# EasyEDA Pro project emg_frontend_reference.epro

# Schematic Schematic1
Assembly Variant: Basic; Board Name: Board1; Create Date: 2026-09-09; Page Name: P1; Project Name: esp32_demo; Schematic Name: Schematic1; Update Date: 2026-09-09; Company: 嘉立创EDA; Page Size: A4; Version: V1.0
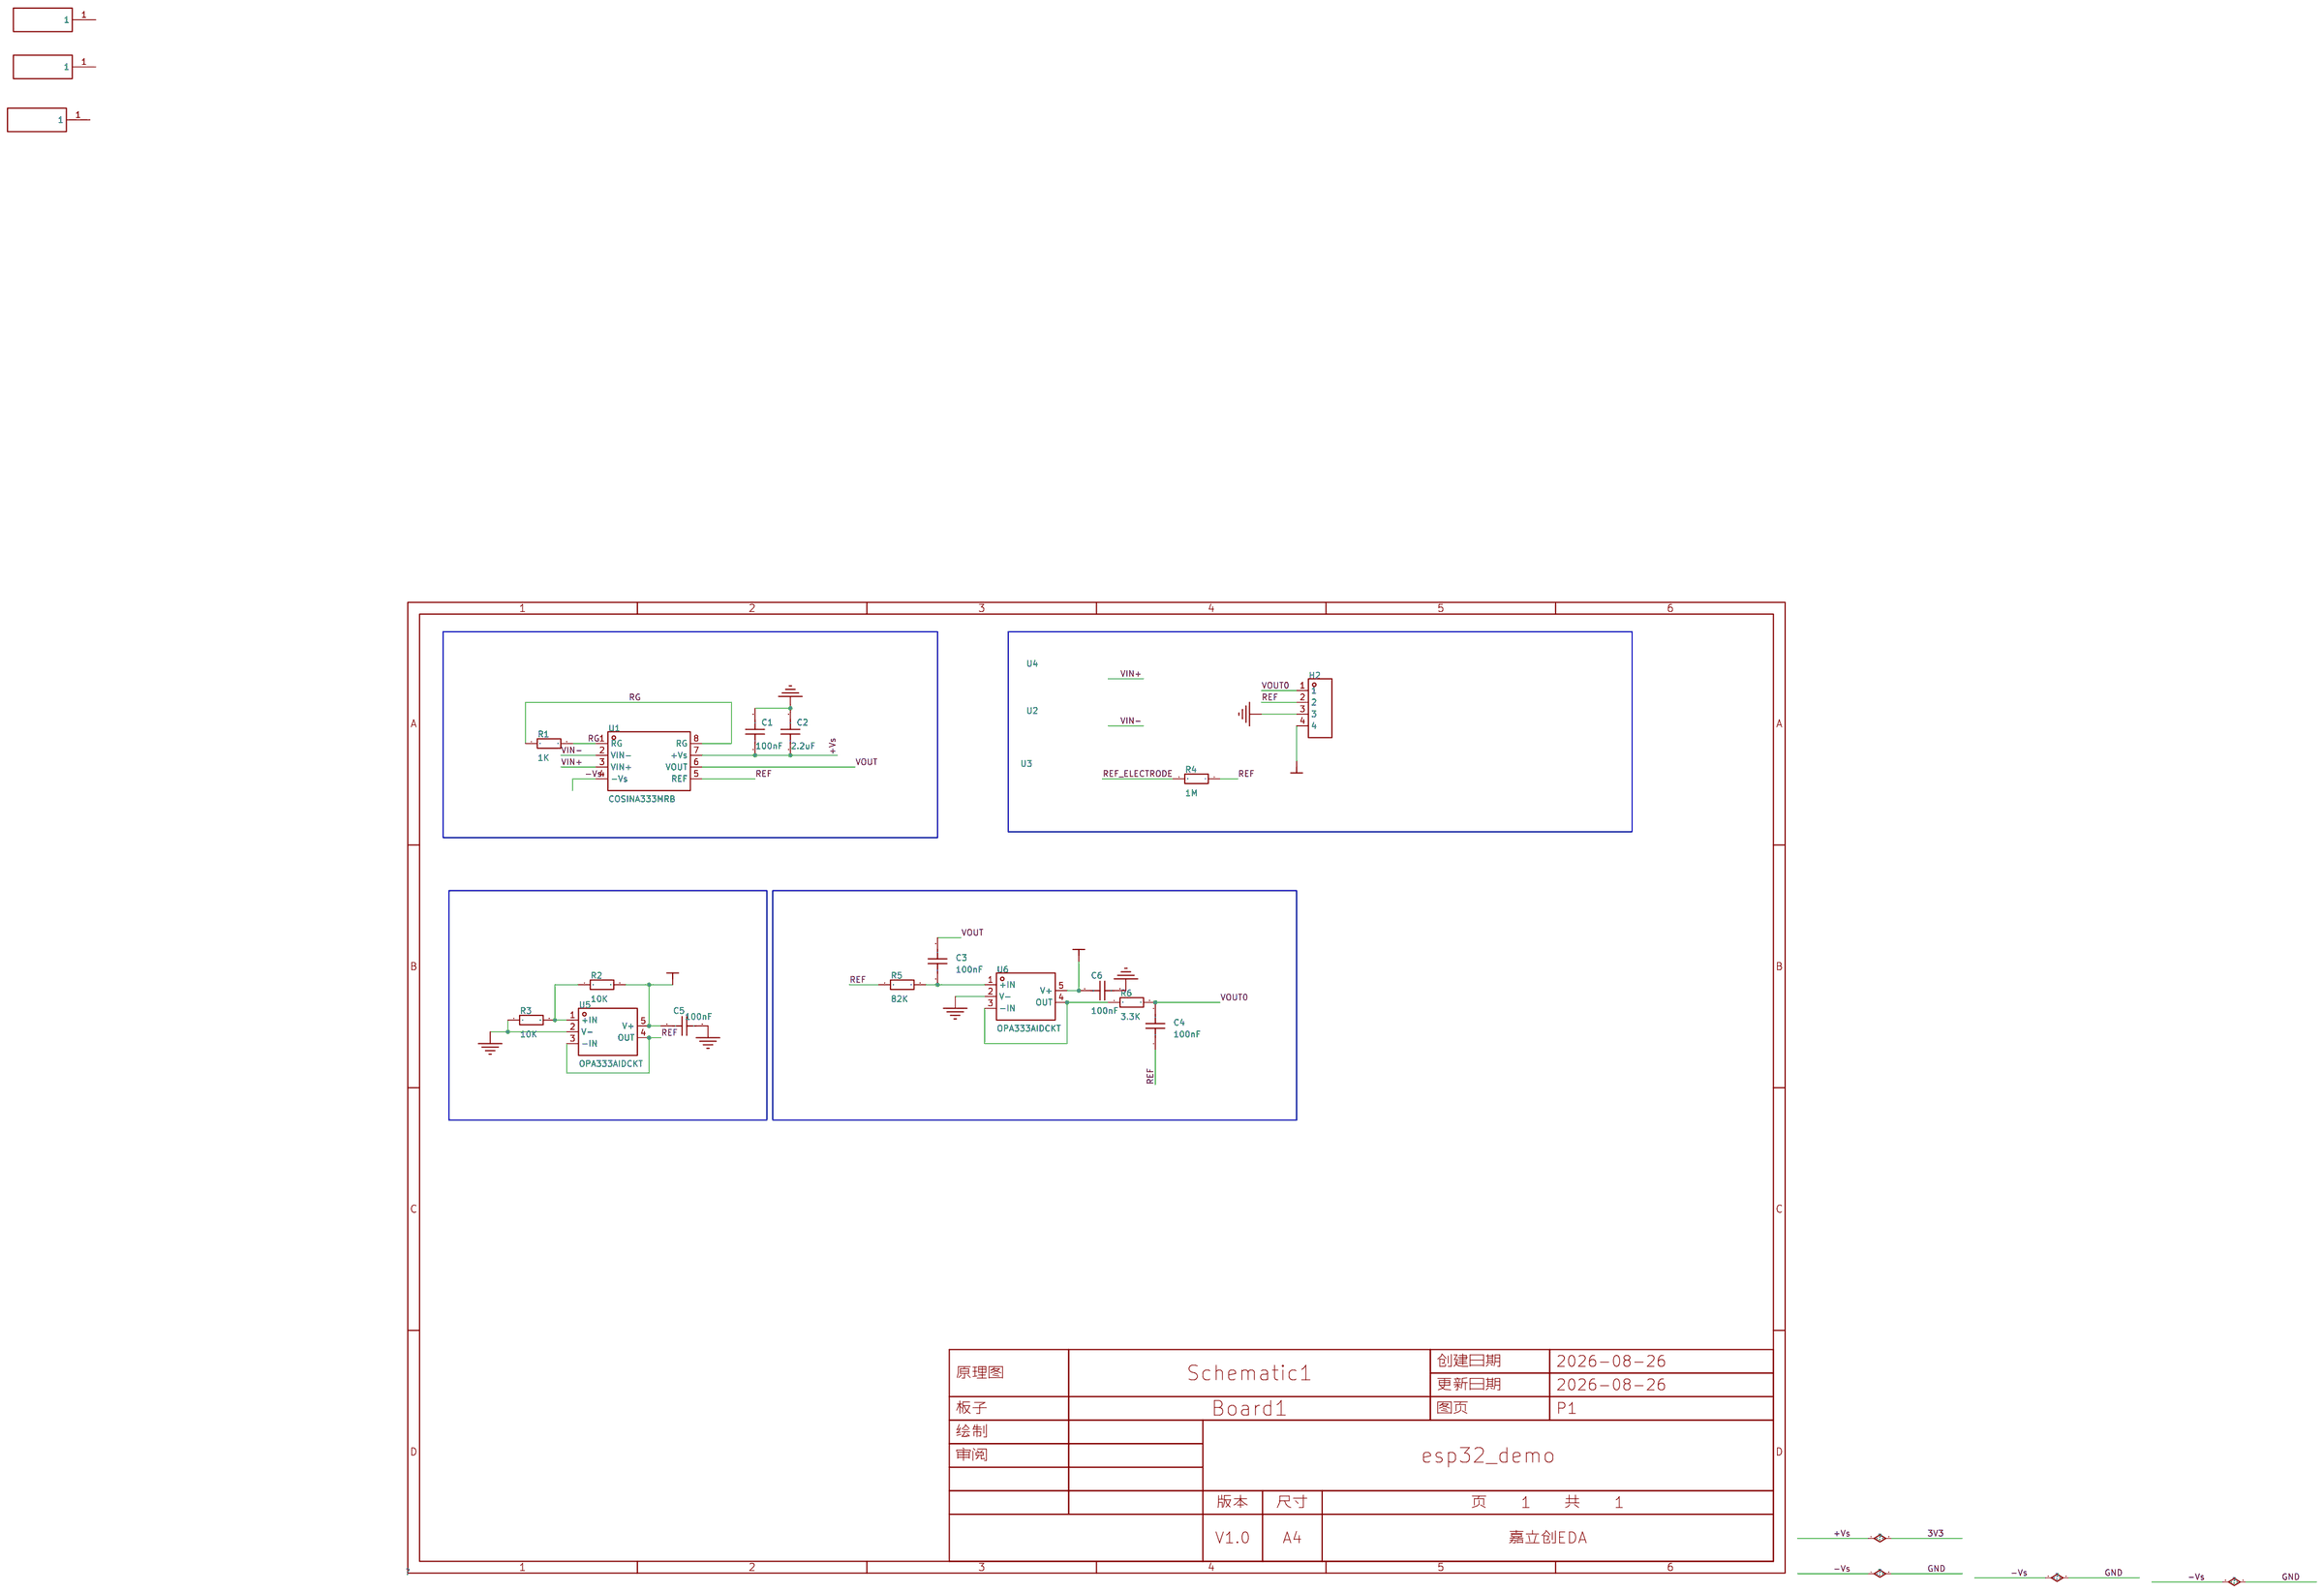
[diagram p0: schematic sheet]

## Parts
C1  100nF  [C0603]
C2  2.2uF  [C0603]
C3  100nF  [C0603]
C4  100nF  [C0603]
C5  100nF  [C0603]
C6  100nF  [C0603]
H2  -  [HDR-TH_4P-P2.54-V-F]
R1  1K  [R0603]
R2  10K  [R0603]
R3  10K  [R0603]
R4  1M  [R0603]
R5  82K  [R0603]
R6  3.3K  [R0603]
U1  COSINA333MRB  [MSOP-8_L3.0-W3.0-P0.65-LS4.9-BL]
U2  -  [EMG_D]
U3  -  [EMG_D]
U4  -  [EMG_D]
U5  OPA333AIDCKT  [SC-70-5_L2.0-W1.3-P0.65-LS2.1-BL]
U6  OPA333AIDCKT  [SC-70-5_L2.0-W1.3-P0.65-LS2.1-BL]

## Library data of the parts
C1-C6 = CAP_0603: Supplier Footprint: 0603
H2 = HDR-F_2.54_1x4P: Supplier Part: C2718488; Supplier Footprint: 插件
R1-R6 = Res_0603: Supplier Footprint: 0603
U1 = COSINA333MRB: 放大器数:单路;共模抑制比(CMRR):120dB;输入偏置电流(Ib):200pA;输入失调电压(Vos):25uV;压摆率(SR):0.25V/us;轨到轨:轨到轨输入,轨到轨输出;; LCSC Part Name: 1.8V - 5.5V, 70uA, RRIO零漂移仪表放大器; Supplier Part: C17702539; Manufacturer: COSINE(科山芯创); Supplier Footprint: MSOP-8; JLCPCB Part Class: Extended Part; Datasheet: https://item.szlcsc.com/datasheet/COSINA333MRB/18841710.html; Supplier: LCSC; Number of Channels: 单路; Common Mode Rejection Ratio(CMRR): 120dB; Ib - Input Bias Current: 200pA; Vos - Input Offset Voltage: 25uV; Slew Rate: 0.25V/us; Output Current: 50mA; Rail to Rail: 轨到轨输入,轨到轨输出; Quiescent Current(Iq): 70uA; Input Offset Voltage Drift(Vos TC): 50nV/℃; Operating Temperature: -40℃~+125℃; Input Voltage Noise Density: 50nV/√Hz@1kHz; Input Offset Current(Ios): 3pA; Single Supply: 1.8V~5.5V; Dual Supply: -2.75V~-900mV；900mV~2.75V; Power Supply Rejection Ratio (PSRR): 130dB; Features: 外部电阻增益；零漂移/自动稳零
U2-U4 = EMG_D1
U5 U6 = OPA333AIDCKT: 放大器数:单路;增益带宽积(GBP):350kHz;输入偏置电流(Ib):70pA;输入失调电压(Vos):10uV;压摆率(SR):0.16V/us;轨到轨:轨到轨输入,轨到轨输出;; LCSC Part Name: OPAx333 1.8V微功耗CMOS运算放大器零漂移系列; Supplier Part: C2057324; Manufacturer: TI(德州仪器); Supplier Footprint: SC-70-5; JLCPCB Part Class: Extended Part; Datasheet: https://www.ti.com/cn/lit/gpn/opa333; Supplier: LCSC; Number of Channels: 单路; Gain Bandwidth Product: 350kHz; Ib - Input Bias Current: 70pA; Vos - Input Offset Voltage: 10uV; Common Mode Rejection Ratio(CMRR): 130dB; Slew Rate: 0.16V/us; Output Current: 5mA; Rail to Rail: 轨到轨输入,轨到轨输出; Input Offset Voltage Drift(Vos TC): 50nV/℃; Quiescent Current(Iq): 17uA; Operating Temperature: -40℃~+125℃; Single Supply: 1.8V~5.5V; Maximum Power Supply Range (Vdd-Vss): 5.5V; Input Offset Current(Ios): 400pA

## Nets
3V3: C1.1 C2.1 C5.1 C6.1 H2.4 R2.2 U1.7(+Vs) U5.5(V+) U6.5(V+)
GND: C1.2 C2.2 C5.2 C6.2 H2.3 R3.1 U1.4(-Vs) U5.2(V-) U6.2(V-)
VIN+: U1.3(VIN+)
VIN-: U1.2(VIN-)
REF: C4.1 H2.2 R4.1 R5.1 U1.5(REF) U5.3(-IN) U5.4(OUT)
REF_ELECTRODE: R4.2
RG: R1.1 R1.2 U1.1(RG) U1.8(RG)
VOUT: C3.2 U1.6(VOUT)
VOUT0: C4.2 H2.1 R6.2
$1N490: R2.1 R3.2 U5.1(+IN)
$1N509: C3.1 R5.2 U6.1(+IN)
$1N512: R6.1 U6.3(-IN) U6.4(OUT)

Not connected (* = marked no-connect by the designer): U2 1; U3 1; U4 1

# Board PCB1_1
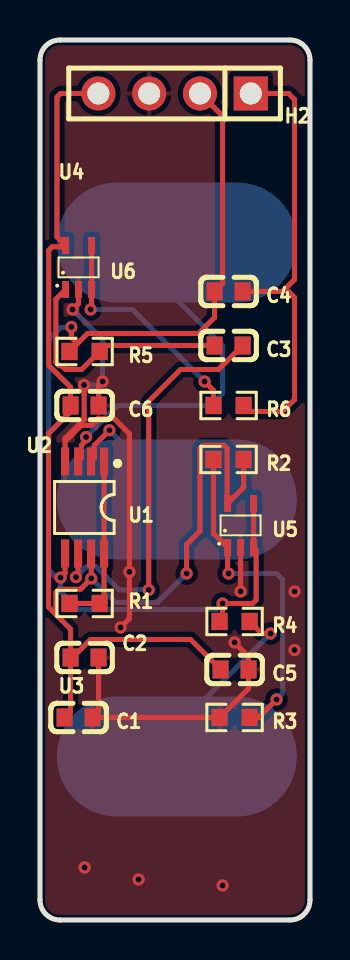
[diagram p1: board, top side]
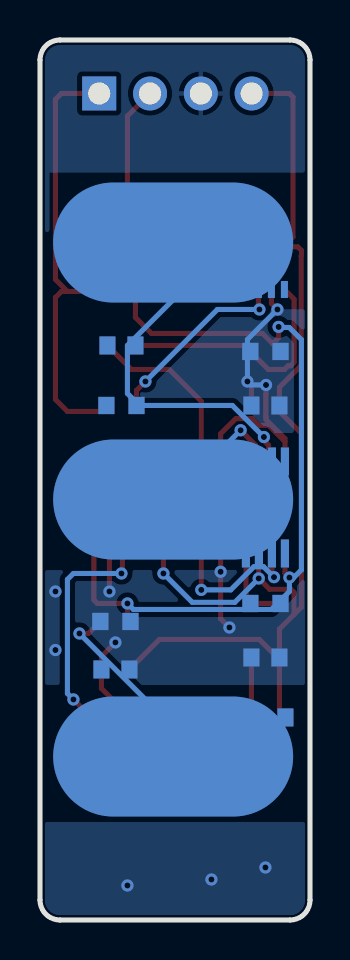
[diagram p2: board, bottom side, seen from below]

Outline 13.5 x 44 mm; copper layers: Top Layer, Bottom Layer. Coordinates in mm from the lower left corner of the outline.
Outline path: 0,43 arc(0.29,43.71) 1,44 12.5,44 arc(13.21,43.71) 13.5,43 13.5,1 arc(13.21,0.29) 12.5,0 1,0 arc(0.29,0.29) 0,1 0,43
Stack: Top Layer 0.035mm / Dielectric1 1.51mm FR4 er 4.5 / Bottom Layer 0.035mm

## Design rules (mm)
spacing copperThickness1oz (default): track to track 0.102, other pairs 0.152 to 0.3
spacing copperThickness2oz: track to track 0.203, other pairs 0.152 to 0.3
spacing Plane_innerPlane: track to track 0.102, other pairs 0.152 to 0.3
spacing Copper_copperRegion: track to track 0.102, other pairs 0.152 to 0.3
track width copperThickness1oz (default): min 0.127, default 0.254, max 2.54
track width copperThickness2oz: min 0.203, default 0.254, max 2.54
differential pair differentialPair (default): width min 0.127, default 0.254, max 2.54; gap min 0.152, default 0.152
net GND uses copperRegion_copperThickness1oz
net REF_ELECTRODE uses copperRegion_copperThickness1oz
net REF uses copperRegion_copperThickness1oz
net $1N512 uses copperRegion_copperThickness1oz
pour e256 uses Copper_copperRegion, copperRegion_Copper_copperRegion
net VOUT0 uses copperRegion_copperThickness1oz
net VOUT uses copperRegion_copperThickness1oz
pour e275 uses Copper_copperRegion, copperRegion_Copper_copperRegion
pour e308 uses Copper_copperRegion, copperRegion_Copper_copperRegion
pour e320 uses Copper_copperRegion, copperRegion_Copper_copperRegion
pour e334 uses Copper_copperRegion, copperRegion_Copper_copperRegion

## Placement (name value [footprint] x y rotation side)
C1  100nF  [C0603]  1.93 10.13 0 top
C2  2.2uF  [C0603]  2.23 13.13 0 top
C3  100nF  [C0603]  9.43 28.73 0 top
C4  100nF  [C0603]  9.43 31.43 0 top
C5  100nF  [C0603]  9.73 12.53 0 top
C6  100nF  [C0603]  2.23 25.73 0 top
H2  -  [HDR-TH_4P-P2.54-V-F]  6.73 41.33 180 top
R1  1K  [R0603]  2.23 15.83 0 top
R2  10K  [R0603]  9.43 23.03 0 top
R3  10K  [R0603]  9.73 10.13 0 top
R4  1M  [R0603]  9.73 14.93 0 top
R5  82K  [R0603]  2.23 28.43 0 top
R6  3.3K  [R0603]  9.43 25.73 0 top
U1  COSINA333MRB  [MSOP-8_L3.0-W3.0-P0.65-LS4.9-BL]  2.23 20.63 180 top
U2  -  [EMG_D]  6.59 21.15 0 top
U3  -  [EMG_D]  6.59 8.3 0 top
U4  -  [EMG_D]  6.59 34 0 top
U5  OPA333AIDCKT  [SC-70-5_L2.0-W1.3-P0.65-LS2.1-BL]  10.03 19.73 0 top
U6  OPA333AIDCKT  [SC-70-5_L2.0-W1.3-P0.65-LS2.1-BL]  1.93 32.63 0 top

## Footprints (pads in the part's own frame, mm; a bottom-side part is the same pattern mirrored in y, then rotated)
C0603
  rect 0.8x0.9 hole 0.001: 1(-0.7,0) 2(0.7,0)
EMG_D
  oval 12x6 smd far side: 1(0.254,-0.127)
HDR-TH_4P-P2.54-V-F
  rect 1.7x1.7 hole 1.1: 1(-3.81,0)
  round 1.7 hole 1.1: 2(-1.27,0) 3(1.27,0) 4(3.81,0)
MSOP-8_L3.0-W3.0-P0.65-LS4.9-BL
  rect 0.406x1.397 hole 0.001: 1(-0.975,-2.3) 2(-0.325,-2.3) 3(0.325,-2.3) 4(0.975,-2.3) 5(0.975,2.3) 6(0.325,2.3) 7(-0.325,2.3) 8(-0.975,2.3)
R0603
  rect 0.806x0.864 hole 0.001: 1(-0.753,0) 2(0.753,0)
SC-70-5_L2.0-W1.3-P0.65-LS2.1-BL
  rect 0.35x0.85 hole 0.001: 1(-0.65,-1.1) 2(0,-1.1) 3(0.65,-1.1) 4(0.65,1.1) 5(-0.65,1.1)

## Nets
3V3: C1.1 C2.1 C5.1 C6.1 H2.4 R2.2 U1.7 U5.5 U6.5
GND: C1.2 C2.2 C5.2 C6.2 H2.3 R3.1 U1.4 U5.2 U6.2
VIN+: U1.3 U4.1
VIN-: U1.2 U2.1
REF: C4.1 H2.2 R4.1 R5.1 U1.5 U5.3 U5.4
REF_ELECTRODE: R4.2 U3.1
RG: R1.1 R1.2 U1.1 U1.8
VOUT: C3.2 U1.6
VOUT0: C4.2 H2.1 R6.2
$1N490: R2.1 R3.2 U5.1
$1N509: C3.1 R5.2 U6.1
$1N512: R6.1 U6.3 U6.4

## Via types
v1: diameter 0.61, hole 0.305, Top Layer to Bottom Layer, 26 vias

## Routing (per net, layer and track width the routed paths; a pad name or vN(x,y) marks a point on that pad's centre or on a via; arc(x,y) is an arc through that point)
3V3: length 67.6
  Top Layer w0.254: H2.4 1.03,41.33 0.85,41.15 0.85,34.16 U6.5 1.21,33.66 0.61,33.66 0.43,33.48 0.43,33.23 0.44,33.22 0.44,27.73 1.53,26.64 1.53,25.43 0.43,24.33 0.43,15.64 0.79,15.28 ; 0.79,15.28 1.53,14.54 C2.1 ; 0.79,15.28 0.79,16.37 0.96,16.54 2.02,16.54 v1(2.56,17.08) 2.56,18.32 U1.7 ; C2.1 1.53,10.43 C1.1 ; C2.1 1.63,13.13 2.53,14.03 7.53,14.03 C5.1 ; R2.2 10.18,21.63 U5.5 9.36,20.85 9.36,23.57 9.19,23.74 8.16,23.74 7.99,23.57 7.99,19.44 7.33,18.78 v1(7.33,17.33)
  Bottom Layer w0.254: v1(2.56,17.08) 3.76,15.88 5.88,15.88 v1(7.33,17.33)
GND: length 42.3
  Top Layer w0.254: 2.93,25.43 2.93,26.73 v1(3.13,26.93) ; v1(2.2,26.75) 2.2,26.3 2.21,26.29 2.21,25.16 2.2,25.15 2.2,25.02 1.25,24.08 1.25,23.92 ; 1.25,23.92 2.06,24.73 2.55,24.73 2.88,25.07 3.71,25.07 4.47,24.31 v1(4.47,17.41) 4.47,15.07 v1(4.03,14.63) ; 1.25,23.92 U1.4 ; U6.2 1.93,30.83 v1(1.63,30.53) ; v1(9.73,13.88) 10.43,13.18 C5.2 10.43,11.58 R3.1 C1.2 2.93,10.43 C2.2 ; U5.2 v1(10.03,16.43)
  Bottom Layer w0.254: v1(2.2,26.75) 2.95,26.75 v1(3.13,26.93) 3.13,29.03 v1(1.63,30.53)
  vias: v1(2.23,2.63) v1(4.93,2.03) v1(9.13,1.73) v1(12.73,16.43) v1(12.73,13.5)
VIN+: length 17.6
  Top Layer w0.254: v1(2.31,24.15) 2.31,23.97 2.07,23.74 2.07,23.09 U1.3
  Bottom Layer w0.254: v1(2.31,24.15) 3.88,25.73 8.53,25.73 9.13,26.33 9.13,28.73 6.84,31.01 U4.1
VIN-: length 6.8
  Top Layer w0.254: v1(3.47,24.49) 2.72,23.74 2.72,23.09 U1.2
  Bottom Layer w0.254: v1(3.47,24.49) 6.84,21.11 U2.1
REF: length 52.6
  Top Layer w0.254: R4.1 9.13,15.08 v1(9.13,15.83) 10.63,15.83 10.81,16.01 10.81,18.5 U5.3 U5.4 ; U1.5 1.25,17.35 v1(1.03,17.12) ; v1(1.57,29.65) 1.57,29.12 1.87,28.82 ; H2.2 9.13,40.2 9.13,31.83 C4.1 8.73,30.13 7.93,29.33 2.38,29.33 1.87,28.82 ; 1.87,28.82 R5.1
  Bottom Layer w0.254: v1(9.13,15.83) 8.83,15.53 1.93,15.53 1.03,16.43 v1(1.03,17.12) 0.81,17.12 0.43,17.51 0.43,29.02 1.04,29.63 1.54,29.63 v1(1.57,29.65)
REF_ELECTRODE: length 9.4
  Top Layer w0.254: v1(11.53,14.33) 11.08,14.33 R4.2
  Bottom Layer w0.254: v1(11.53,14.33) 6.84,9.64 U3.1
RG: length 8.7
  Top Layer w0.254: R1.1 R1.2 3.2,16.05 3.2,22.93
VOUT: length 20.8
  Top Layer w0.254: U1.6 1.9,17.25 v1(1.8,17.14) ; v1(5.44,16.51) 5.44,25.93 7.03,27.53 8.93,27.53 C3.2
  Bottom Layer w0.254: v1(1.8,17.14) 2.32,17.66 2.81,17.66 3.96,16.51 v1(5.44,16.51)
VOUT0: length 22.9
  Top Layer w0.254: 12.13,31.43 12.73,32.03 12.73,41.03 12.43,41.33 H2.1 ; C4.2 12.43,31.43 12.73,31.13 12.73,26.03 12.13,25.43 10.48,25.43 R6.2
$1N490: length 16.7
  Top Layer w0.254: R3.2 10.93,10.13 v1(11.83,11.03) ; R2.1 8.68,19.33 U5.1 9.38,17.38 v1(9.43,17.33)
  Bottom Layer w0.254: v1(9.43,17.33) 11.83,17.33 12.13,17.03 12.13,11.33 v1(11.83,11.03)
$1N509: length 12.4
  Top Layer w0.254: C3.1 3.28,28.73 R5.2 2.08,27.53 1.28,27.53 1.09,27.72 0.96,27.72 0.79,27.88 0.79,31.04 U6.1
$1N512: length 11.8
  Top Layer w0.254: R6.1 8.68,26.48 v1(8.23,26.93) ; v1(2.53,30.53) 2.58,30.58 U6.3 U6.4
  Bottom Layer w0.254: v1(8.23,26.93) 4.63,30.53 v1(2.53,30.53)

## Copper pours and planes (outline as drawn; the poured copper is in the pictures)
GND on Top Layer: -6.17,49.13 18.73,49.13 18.73,-2.17 -6.17,-2.17
GND on Bottom Layer: -1.97,23.03 16.63,23.03 16.63,15.23 -1.97,15.23
GND on Bottom Layer: -4.37,47.33 18.43,47.33 18.43,-1.57 -4.37,-1.57
GND on Bottom Layer: -3.52,12.73 17.83,12.73 17.83,-2.77 -3.52,-2.77
GND on Bottom Layer: -6.17,44.63 20.53,44.63 20.53,-0.67 -6.17,-0.67

# Board PCB1
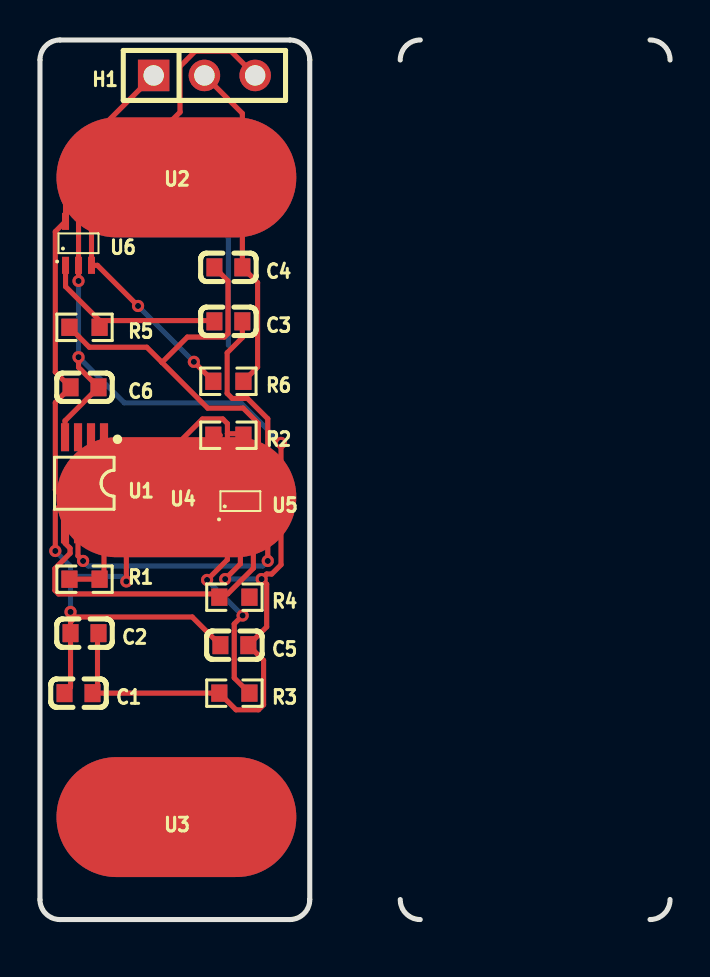
[diagram p3: board, top side]
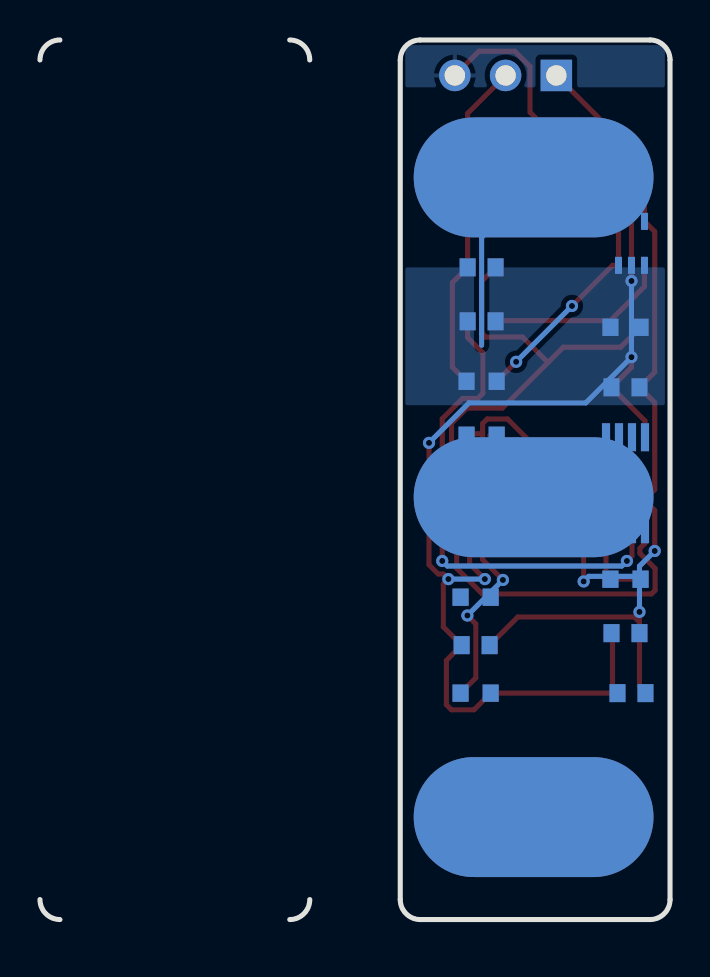
[diagram p4: board, bottom side, seen from below]

Outline 31.53 x 44 mm; copper layers: Top Layer, Bottom Layer. Coordinates in mm from the lower left corner of the outline.
Outline path: 18.03,43 arc(18.32,43.71) 19.03,44 ; 19.03,0 arc(18.32,0.29) 18.03,1 ; 30.53,44 arc(31.24,43.71) 31.53,43 ; 31.53,1 arc(31.24,0.29) 30.53,0 ; 0,43 arc(0.29,43.71) 1,44 12.5,44 arc(13.21,43.71) 13.5,43 13.5,1 arc(13.21,0.29) 12.5,0 1,0 arc(0.29,0.29) 0,1 0,43
Stack: Top Layer 0.035mm / Dielectric1 1.51mm FR4 er 4.5 / Bottom Layer 0.035mm

## Design rules (mm)
spacing copperThickness1oz (default): track to track 0.102, other pairs 0.152 to 0.3
spacing copperThickness2oz: track to track 0.203, other pairs 0.152 to 0.3
spacing Plane_innerPlane: track to track 0.102, other pairs 0.152 to 0.3
spacing Copper_copperRegion: track to track 0.102, other pairs 0.152 to 0.3
spacing Copper_copperRegion_copperThickness1oz: track to track 0.102, other pairs 0.152 to 0.3
spacing Copper_copperRegion_Copper_copperRegion: track to track 0.102, other pairs 0.152 to 0.3
track width copperThickness1oz (default): min 0.127, default 0.254, max 2.54
track width copperThickness2oz: min 0.203, default 0.254, max 2.54
differential pair differentialPair (default): width min 0.127, default 0.254, max 2.54; gap min 0.152, default 0.152
net GND uses copperRegion_copperThickness1oz
pour e138 uses Copper_copperRegion, copperRegion_Copper_copperRegion
pour e139 uses Copper_copperRegion, copperRegion_Copper_copperRegion

## Placement (name value [footprint] x y rotation side)
C1  100nF  [C0603]  1.93 11.33 0 top
C2  2.2uF  [C0603]  2.23 14.33 0 top
C3  100nF  [C0603]  9.43 29.93 0 top
C4  100nF  [C0603]  9.43 32.63 0 top
C5  100nF  [C0603]  9.73 13.73 0 top
C6  100nF  [C0603]  2.23 26.63 0 top
H1  -  [HDR-TH_3P-P2.54-V-F]  8.23 42.23 0 top
R1  1K  [R0603]  2.23 17.03 0 top
R2  10K  [R0603]  9.43 24.23 0 top
R3  10K  [R0603]  9.73 11.33 0 top
R4  1M  [R0603]  9.73 16.13 0 top
R5  82K  [R0603]  2.23 29.63 0 top
R6  3.3K  [R0603]  9.43 26.93 0 top
U1  COSINA333MRB  [MSOP-8_L3.0-W3.0-P0.65-LS4.9-BL]  2.23 21.83 180 top
U2  -  [sEMG_Electrode_12x6_R1.2]  6.83 37.13 0 top
U3  -  [sEMG_Electrode_12x6_R1.2]  6.83 5.13 0 top
U4  -  [sEMG_Electrode_12x6_R1.2]  6.83 21.13 0 top
U5  OPA333AIDCKT  [SC-70-5_L2.0-W1.3-P0.65-LS2.1-BL]  10.03 20.93 0 top
U6  OPA333AIDCKT  [SC-70-5_L2.0-W1.3-P0.65-LS2.1-BL]  1.93 33.83 0 top

## Footprints (pads in the part's own frame, mm; a bottom-side part is the same pattern mirrored in y, then rotated)
C0603
  rect 0.8x0.9 hole 0.001: 1(-0.7,0) 2(0.7,0)
HDR-TH_3P-P2.54-V-F
  rect 1.575x1.575 hole 1.02: 1(-2.54,0)
  round 1.575 hole 1.02: 2(0,0) 3(2.54,0)
MSOP-8_L3.0-W3.0-P0.65-LS4.9-BL
  rect 0.406x1.397 hole 0.001: 1(-0.975,-2.3) 2(-0.325,-2.3) 3(0.325,-2.3) 4(0.975,-2.3) 5(0.975,2.3) 6(0.325,2.3) 7(-0.325,2.3) 8(-0.975,2.3)
R0603
  rect 0.806x0.864 hole 0.001: 1(-0.753,0) 2(0.753,0)
SC-70-5_L2.0-W1.3-P0.65-LS2.1-BL
  rect 0.35x0.85 hole 0.001: 1(-0.65,-1.1) 2(0,-1.1) 3(0.65,-1.1) 4(0.65,1.1) 5(-0.65,1.1)
sEMG_Electrode_12x6_R1.2
  oval 12x6 hole 0.001: 2(0,0)

## Nets
3V3: C1.1 C2.1 C5.1 C6.1 H1.1 R2.2 U1.7 U5.5 U6.5
GND: C1.2 C2.2 C5.2 C6.2 H1.3 R3.1 U1.4 U5.2 U6.2
VIN+: U1.3
VIN-: U1.2
GPIO3: C4.2 H1.2 R6.2
REF: C4.1 R4.1 R5.1 U1.5 U5.3 U5.4
REF_ELECTRODE: R4.2
RG: R1.1 R1.2 U1.1 U1.8
VOUT: C3.2 U1.6
$1N87: R2.1 R3.2 U5.1
$1N101: C3.1 R5.2 U6.1
$1N103: R6.1 U6.3 U6.4

Pads without a net: U2 2; U3 2; U4 2

## Via types
v1: diameter 0.61, hole 0.305, Top Layer to Bottom Layer, 14 vias

## Routing (per net, layer and track width the routed paths; a pad name or vN(x,y) marks a point on that pad's centre or on a via; arc(x,y) is an arc through that point)
3V3: length 62.6
  Top Layer w0.254: v1(4.32,16.91) 4.32,21.23 8.13,25.04 9.15,25.04 9.38,24.81 9.38,24.3 ; R2.2 10.1,24.3 9.38,24.3 ; U1.7 2.55,20.22 2.05,20.73 1.54,20.73 ; 9.38,24.3 U5.5 ; H1.1 1.28,37.82 U6.5 0.77,34.41 0.77,27.39 C6.1 0.77,25.86 0.77,21.5 1.54,20.73 ; C5.1 7.62,15.14 1.78,15.14 1.53,14.88 ; C1.1 1.53,11.63 C2.1 1.53,14.88 ; 1.53,14.88 v1(1.53,15.39) ; v1(0.77,18.44) 0.77,20.47 1.03,20.73 1.54,20.73
  Bottom Layer w0.254: v1(0.77,18.44) 1.53,17.68 1.53,17.17 ; 1.53,17.17 4.07,17.17 v1(4.32,16.91) ; 1.53,17.17 v1(1.53,15.39)
GND: length 69.7
  Top Layer w0.254: U1.4 1.25,24.95 C6.2 1.93,27.63 v1(1.93,28.13) ; C2.2 2.88,14.28 2.88,11.33 ; 2.88,11.33 C1.2 ; 2.88,11.33 R3.1 9.81,10.49 10.94,10.49 11.19,10.75 11.19,12.96 C5.2 11.34,14.64 11.34,16.78 v1(11.09,17.03) 11.34,17.29 11.6,17.29 12.06,17.75 v1(12.06,23.84) ; H1.3 9.56,43.44 7.77,43.44 7.01,42.68 7.01,40.39 1.93,35.31 U6.2 v1(1.93,31.94) ; U5.2 10.03,17.79 v1(9.27,17.03)
  Bottom Layer w0.254: v1(11.09,17.03) v1(9.27,17.03) ; v1(1.93,31.94) v1(1.93,28.13) 4.22,25.85 10.06,25.85 v1(12.06,23.84)
(no net): length 5.8
  Bottom Layer w0.254: 9.13,34.43 9.43,34.13 9.43,28.73
GPIO3: length 16.7
  Top Layer w0.254: H1.2 10.13,40.33 C4.2 10.89,31.86 10.89,27.63 R6.2
REF: length 40.3
  Top Layer w0.254: R5.1 2.47,28.63 5.34,28.63 6.11,27.87 ; 6.11,27.87 7.38,29.14 9.23,29.14 9.41,29.32 9.41,31.95 C4.1 ; 6.11,27.87 8.39,25.58 10.17,25.58 10.93,24.82 10.93,22.28 U5.4 U5.3 10.68,17.58 9.39,16.29 0.93,16.29 0.75,16.47 0.75,17.56 1.51,18.32 1.51,18.57 1.25,18.83 U1.5
RG: length 8.7
  Top Layer w0.254: 3.2,24.13 3.2,17.25 R1.2 R1.1
VOUT: length 24.7
  Top Layer w0.254: v1(11.4,17.94) 11.4,25.05 10.38,26.07 9.62,26.07 9.37,26.32 9.37,28.35 10.13,29.11 C3.2 ; U1.6 1.9,18.19 v1(2.16,17.94)
  Bottom Layer w0.254: v1(2.16,17.94) 2.41,17.68 11.15,17.68 v1(11.4,17.94)
$1N87: length 15.2
  Top Layer w0.254: R3.2 9.72,12.09 9.72,14.79 v1(10.14,15.21) ; 9.02,24.23 R2.1 8.68,20.53 U5.1 9.38,18 v1(8.36,16.99)
  Bottom Layer w0.254: v1(8.36,16.99) v1(10.14,15.21)
$1N101: length 9.6
  Top Layer w0.254: 2.98,29.96 8.69,29.96 C3.1 ; 2.98,29.96 R5.2 ; 2.98,29.96 1.28,31.67 U6.1
$1N103: length 10.7
  Top Layer w0.254: v1(7.7,27.9) R6.1 ; U6.4 U6.3 2.88,32.73 v1(4.91,30.69)
  Bottom Layer w0.254: v1(4.91,30.69) v1(7.7,27.9)

## Copper pours and planes (outline as drawn; the poured copper is in the pictures)
GND on Top Layer: -1.37,44.93 14.83,44.93 14.83,-0.97 -1.37,-0.97
GND on Bottom Layer: -1.37,44.63 15.13,44.63 15.13,-0.67 -1.37,-0.67
